# Altium schematic sheet a0206-2006.4.SchDoc
size 558 x 431 mm
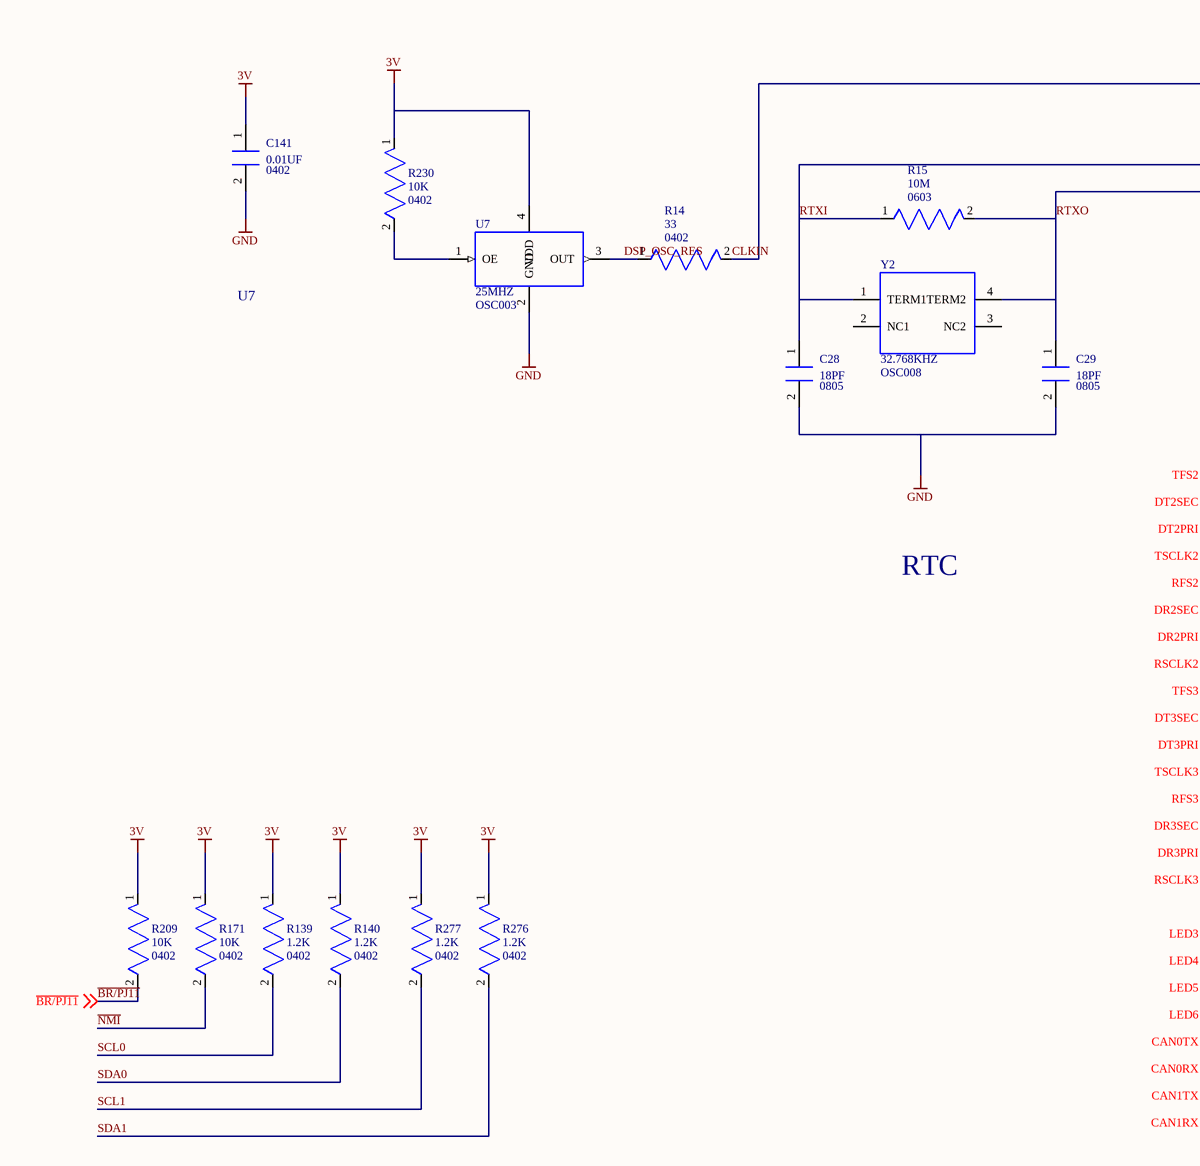
[diagram p0: a0206-2006.4.SchDoc, top left]
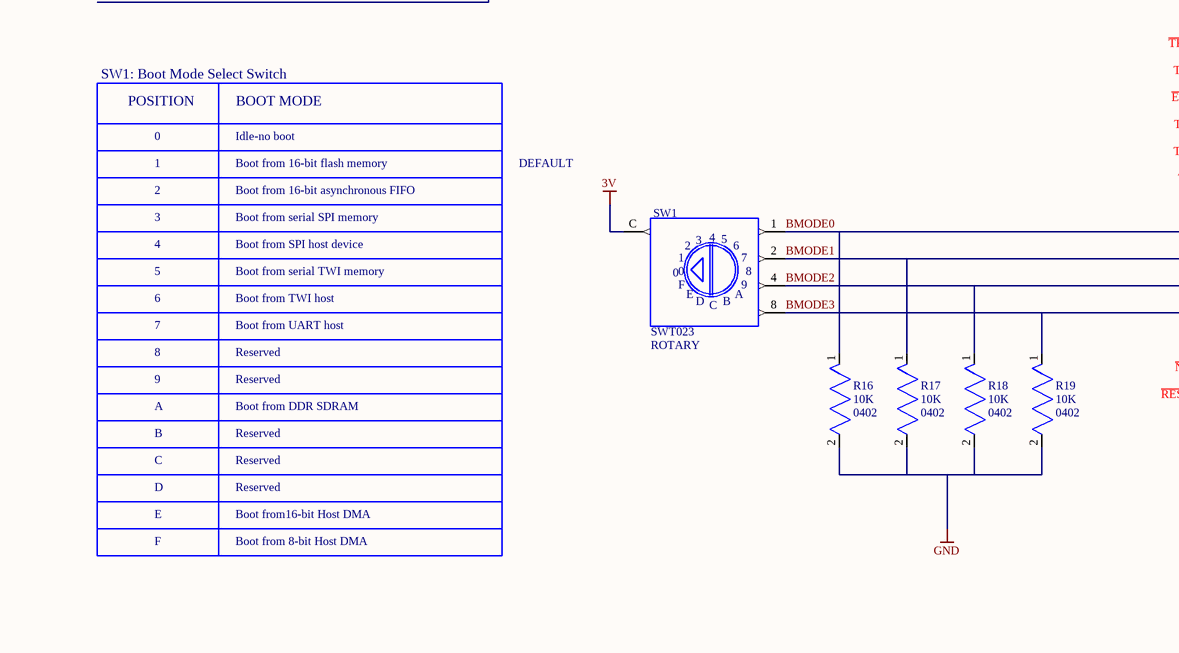
[diagram p1: a0206-2006.4.SchDoc, bottom left]
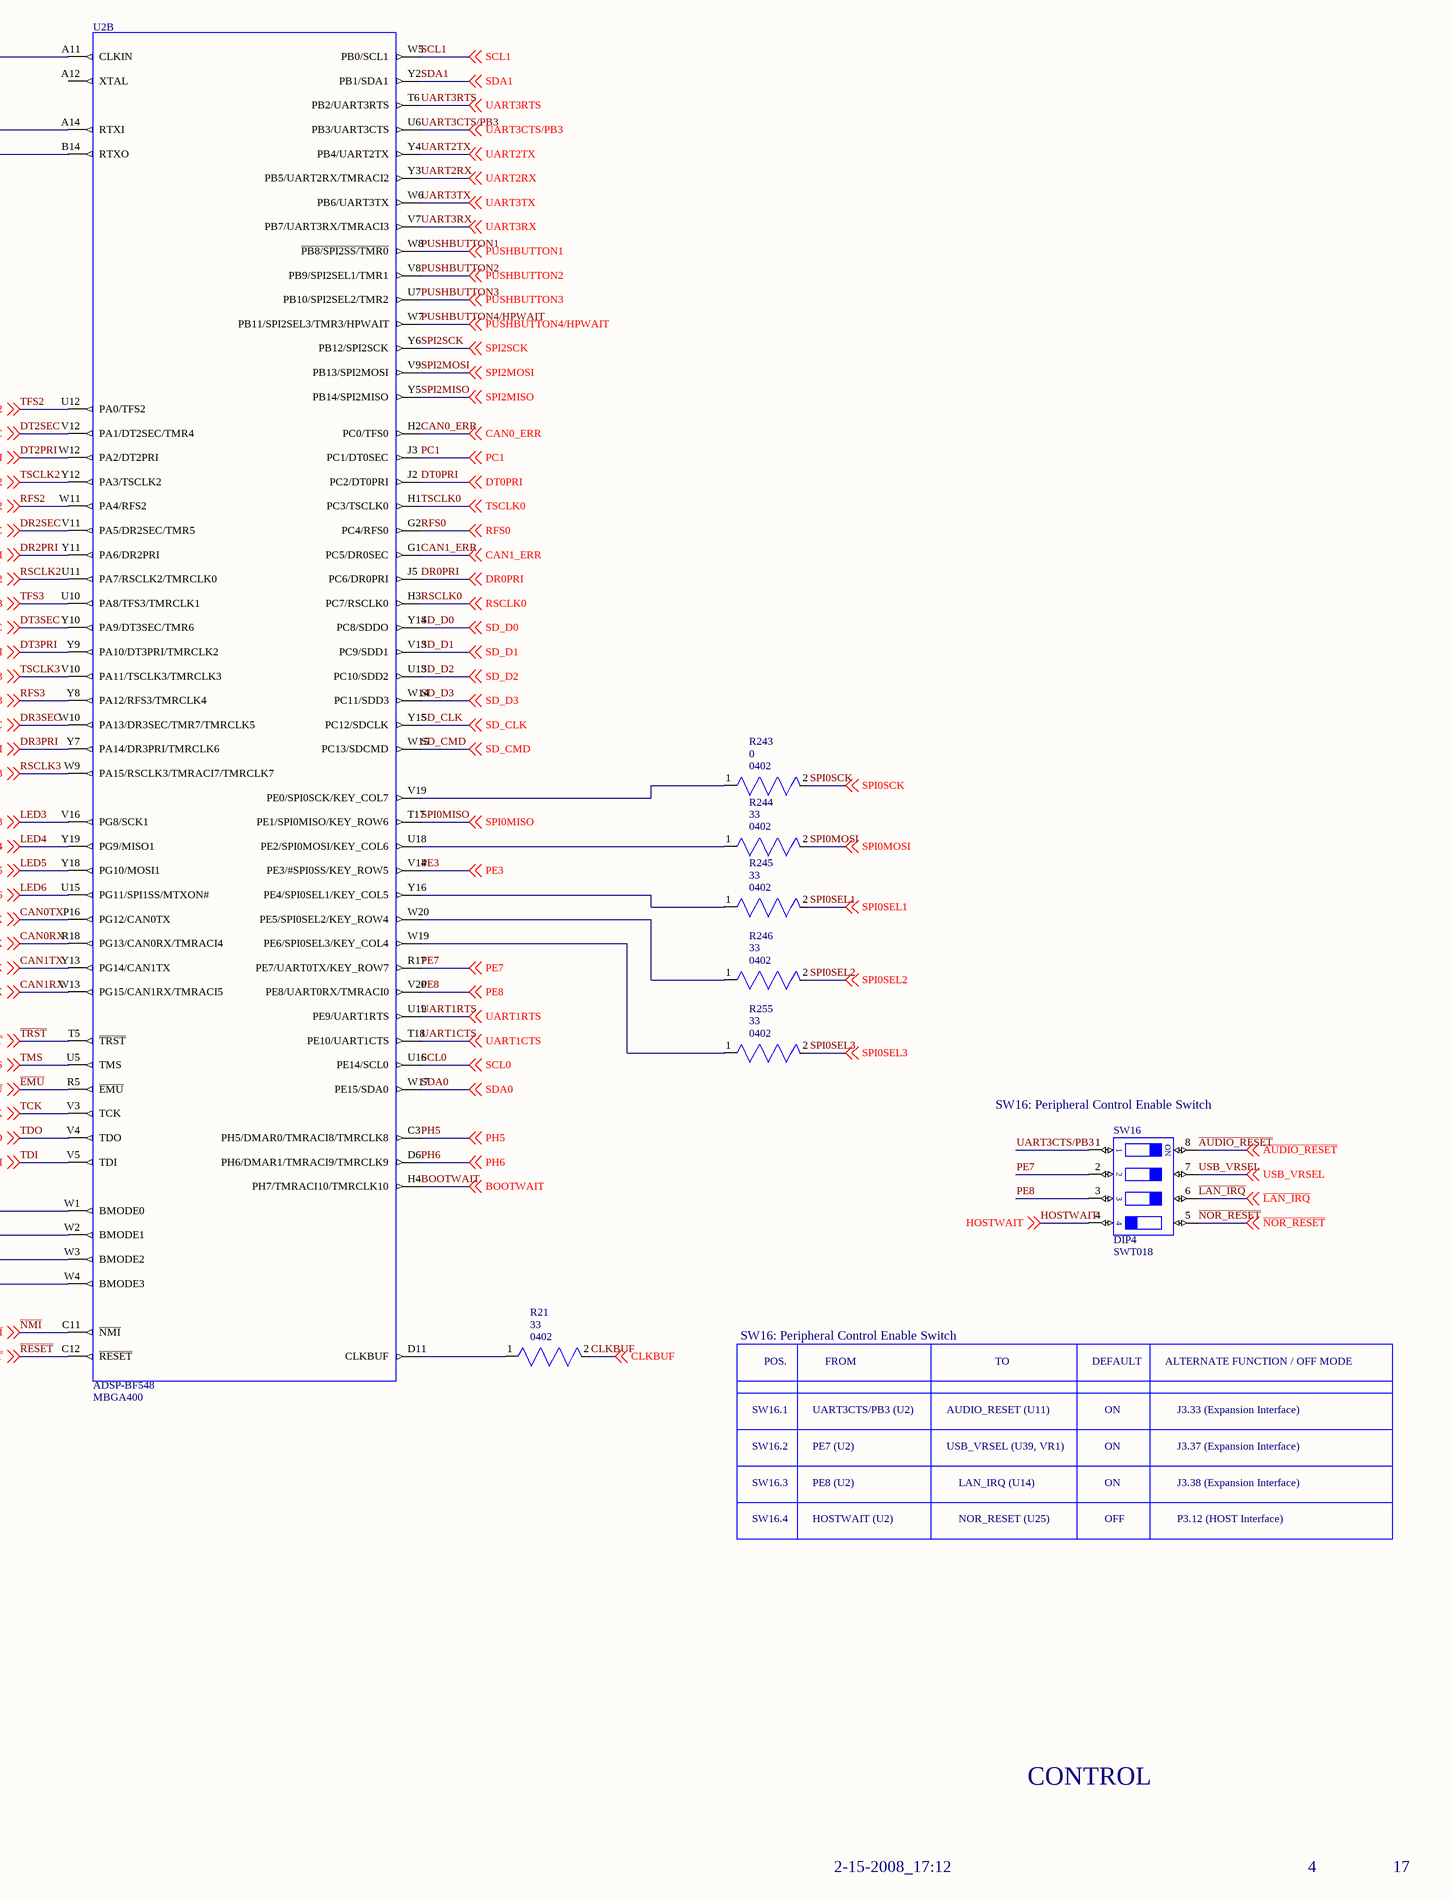
[diagram p2: a0206-2006.4.SchDoc, bottom right]

## Parts
C28  value 18PF  [0805]  (hidden comment: *)
C29  value 18PF  [0805]  (hidden comment: *)
C141  value 0.01UF  [0402]  (hidden comment: *)
R14  value 33  [0402]  (hidden comment: *)
R15  value 10M  [0603]  (hidden comment: *)
R16  value 10K  [0402]  (hidden comment: *)
R17  value 10K  [0402]  (hidden comment: *)
R18  value 10K  [0402]  (hidden comment: *)
R19  value 10K  [0402]  (hidden comment: *)
R21  value 33  [0402]  (hidden comment: *)
R139  value 1.2K  [0402]  (hidden comment: *)
R140  value 1.2K  [0402]  (hidden comment: *)
R171  value 10K  [0402]  (hidden comment: *)
R209  value 10K  [0402]  (hidden comment: *)
R230  value 10K  [0402]  (hidden comment: *)
R243  value 0  [0402]  (hidden comment: *)
R244  value 33  [0402]  (hidden comment: *)
R245  value 33  [0402]  (hidden comment: *)
R246  value 33  [0402]  (hidden comment: *)
R255  value 33  [0402]  (hidden comment: *)
R276  value 1.2K  [0402]  (hidden comment: *)
R277  value 1.2K  [0402]  (hidden comment: *)
SW1  value ROTARY  [SWT023]  (hidden comment: *)
SW16  value DIP4  [SWT018]  (hidden comment: *)
U2  PART: ADSP-BF548  PKG_TYPE: MBGA400  (hidden comment: ICS_ADSPBF548)  (part B of 7)
U7  value 25MHZ  [OSC003]  (hidden comment: *)
Y2  value 32.768KHZ  [OSC008]  (hidden comment: *)

## Nets
3V: C141.1(A) R139.1(N1) R140.1(N1) R171.1(N1) R209.1(N1) R230.1(N1) R276.1(N1) R277.1(N1) SW1.C U7.4(VDD)
GND: C28.2(B) C29.2(B) C141.2(B) R16.2(N2) R17.2(N2) R18.2(N2) R19.2(N2) U7.2(GND)
~{AUDIO_RESET}: SW16.8 ; off-sheet ~{AUDIO_RESET}
~{BR/PJ11}: R209.2(N2) ; off-sheet ~{BR/PJ11}
BMODE0: R16.1(N1) SW1.1(~{1}) U2.W1(BMODE0)
BMODE1: R17.1(N1) SW1.2(~{2}) U2.W2(BMODE1)
BMODE2: R18.1(N1) SW1.4(~{4}) U2.W3(BMODE2)
BMODE3: R19.1(N1) SW1.8(~{8}) U2.W4(BMODE3)
BOOTWAIT: U2.H4(PH7/TMRACI10/TMRCLK10) ; off-sheet BOOTWAIT
CAN0_ERR: U2.H2(PC0/TFS0) ; off-sheet CAN0_ERR
CAN0RX: U2.R18(PG13/CAN0RX/TMRACI4) ; off-sheet CAN0RX
CAN0TX: U2.P16(PG12/CAN0TX) ; off-sheet CAN0TX
CAN1_ERR: U2.G1(PC5/DR0SEC) ; off-sheet CAN1_ERR
CAN1RX: U2.W13(PG15/CAN1RX/TMRACI5) ; off-sheet CAN1RX
CAN1TX: U2.Y13(PG14/CAN1TX) ; off-sheet CAN1TX
CLKBUF: R21.2(N2) ; off-sheet CLKBUF
CLKIN: R14.2(N2) U2.A11(CLKIN)
DR0PRI: U2.J5(PC6/DR0PRI) ; off-sheet DR0PRI
DR2PRI: U2.Y11(PA6/DR2PRI) ; off-sheet DR2PRI
DR2SEC: U2.V11(PA5/DR2SEC/TMR5) ; off-sheet DR2SEC
DR3PRI: U2.Y7(PA14/DR3PRI/TMRCLK6) ; off-sheet DR3PRI
DR3SEC: U2.W10(PA13/DR3SEC/TMR7/TMRCLK5) ; off-sheet DR3SEC
DSP_OSC_RES: R14.1(N1) U7.3(OUT)
DT0PRI: U2.J2(PC2/DT0PRI) ; off-sheet DT0PRI
DT2PRI: U2.W12(PA2/DT2PRI) ; off-sheet DT2PRI
DT2SEC: U2.V12(PA1/DT2SEC/TMR4) ; off-sheet DT2SEC
DT3PRI: U2.Y9(PA10/DT3PRI/TMRCLK2) ; off-sheet DT3PRI
DT3SEC: U2.Y10(PA9/DT3SEC/TMR6) ; off-sheet DT3SEC
~{EMU}: U2.R5(~{EMU}) ; off-sheet ~{EMU}
HOSTWAIT: SW16.4 ; off-sheet HOSTWAIT
~{LAN_IRQ}: SW16.6 ; off-sheet ~{LAN_IRQ}
LED3: U2.V16(PG8/SCK1) ; off-sheet LED3
LED4: U2.Y19(PG9/MISO1) ; off-sheet LED4
LED5: U2.Y18(PG10/MOSI1) ; off-sheet LED5
LED6: U2.U15(PG11/SPI1SS/MTXON#) ; off-sheet LED6
~{NMI}: R171.2(N2) U2.C11(~{NMI}) ; off-sheet ~{NMI}
~{NOR_RESET}: SW16.5 ; off-sheet ~{NOR_RESET}
PC1: U2.J3(PC1/DT0SEC) ; off-sheet PC1
PE3: U2.V14(PE3/#SPI0SS/KEY_ROW5) ; off-sheet PE3
PE7: SW16.2 U2.R17(PE7/UART0TX/KEY_ROW7) ; off-sheet PE7
PE8: SW16.3 U2.V20(PE8/UART0RX/TMRACI0) ; off-sheet PE8
PH5: U2.C3(PH5/DMAR0/TMRACI8/TMRCLK8) ; off-sheet PH5
PH6: U2.D6(PH6/DMAR1/TMRACI9/TMRCLK9) ; off-sheet PH6
PUSHBUTTON1: U2.W8(~{PB8/SPI2SS/TMR0}) ; off-sheet PUSHBUTTON1
PUSHBUTTON2: U2.V8(PB9/SPI2SEL1/TMR1) ; off-sheet PUSHBUTTON2
PUSHBUTTON3: U2.U7(PB10/SPI2SEL2/TMR2) ; off-sheet PUSHBUTTON3
PUSHBUTTON4/HPWAIT: U2.W7(PB11/SPI2SEL3/TMR3/HPWAIT) ; off-sheet PUSHBUTTON4/HPWAIT
~{RESET}: U2.C12(~{RESET}) ; off-sheet ~{RESET}
RFS0: U2.G2(PC4/RFS0) ; off-sheet RFS0
RFS2: U2.W11(PA4/RFS2) ; off-sheet RFS2
RFS3: U2.Y8(PA12/RFS3/TMRCLK4) ; off-sheet RFS3
RSCLK0: U2.H3(PC7/RSCLK0) ; off-sheet RSCLK0
RSCLK2: U2.U11(PA7/RSCLK2/TMRCLK0) ; off-sheet RSCLK2
RSCLK3: U2.W9(PA15/RSCLK3/TMRACI7/TMRCLK7) ; off-sheet RSCLK3
RTXI: C28.1(A) R15.1(N1) U2.A14(RTXI) Y2.1(TERM1)
RTXO: C29.1(A) R15.2(N2) U2.B14(RTXO) Y2.4(TERM2)
SCL0: R139.2(N2) U2.U16(PE14/SCL0) ; off-sheet SCL0
SCL1: R277.2(N2) U2.W5(PB0/SCL1) ; off-sheet SCL1
SD_CLK: U2.Y15(PC12/SDCLK) ; off-sheet SD_CLK
SD_CMD: U2.W15(PC13/SDCMD) ; off-sheet SD_CMD
SD_D0: U2.Y14(PC8/SDDO) ; off-sheet SD_D0
SD_D1: U2.V13(PC9/SDD1) ; off-sheet SD_D1
SD_D2: U2.U13(PC10/SDD2) ; off-sheet SD_D2
SD_D3: U2.W14(PC11/SDD3) ; off-sheet SD_D3
SDA0: R140.2(N2) U2.W17(PE15/SDA0) ; off-sheet SDA0
SDA1: R276.2(N2) U2.Y2(PB1/SDA1) ; off-sheet SDA1
SPI0MISO: U2.T17(PE1/SPI0MISO/KEY_ROW6) ; off-sheet SPI0MISO
SPI0MOSI: R244.2(N2) ; off-sheet SPI0MOSI
SPI0SCK: R243.2(N2) ; off-sheet SPI0SCK
SPI0SEL1: R245.2(N2) ; off-sheet SPI0SEL1
SPI0SEL2: R246.2(N2) ; off-sheet SPI0SEL2
SPI0SEL3: R255.2(N2) ; off-sheet SPI0SEL3
SPI2MISO: U2.Y5(PB14/SPI2MISO) ; off-sheet SPI2MISO
SPI2MOSI: U2.V9(PB13/SPI2MOSI) ; off-sheet SPI2MOSI
SPI2SCK: U2.Y6(PB12/SPI2SCK) ; off-sheet SPI2SCK
~{TRST}: U2.T5(~{TRST}) ; off-sheet ~{TRST}
TCK: U2.V3(TCK) ; off-sheet TCK
TDI: U2.V5(TDI) ; off-sheet TDI
TDO: U2.V4(TDO) ; off-sheet TDO
TFS2: U2.U12(PA0/TFS2) ; off-sheet TFS2
TFS3: U2.U10(PA8/TFS3/TMRCLK1) ; off-sheet TFS3
TMS: U2.U5(TMS) ; off-sheet TMS
TSCLK0: U2.H1(PC3/TSCLK0) ; off-sheet TSCLK0
TSCLK2: U2.Y12(PA3/TSCLK2) ; off-sheet TSCLK2
TSCLK3: U2.V10(PA11/TSCLK3/TMRCLK3) ; off-sheet TSCLK3
UART1CTS: U2.T18(PE10/UART1CTS) ; off-sheet UART1CTS
UART1RTS: U2.U19(PE9/UART1RTS) ; off-sheet UART1RTS
UART2RX: U2.Y3(PB5/UART2RX/TMRACI2) ; off-sheet UART2RX
UART2TX: U2.Y4(PB4/UART2TX) ; off-sheet UART2TX
UART3CTS/PB3: SW16.1 U2.U6(PB3/UART3CTS) ; off-sheet UART3CTS/PB3
UART3RTS: U2.T6(PB2/UART3RTS) ; off-sheet UART3RTS
UART3RX: U2.V7(PB7/UART3RX/TMRACI3) ; off-sheet UART3RX
UART3TX: U2.W6(PB6/UART3TX) ; off-sheet UART3TX
USB_VRSEL: SW16.7 ; off-sheet USB_VRSEL
NetR21_1: R21.1(N1) U2.D11(CLKBUF)
NetR230_2: R230.2(N2) U7.1(OE)
NetR243_1: R243.1(N1) U2.V19(PE0/SPI0SCK/KEY_COL7)
NetR244_1: R244.1(N1) U2.U18(PE2/SPI0MOSI/KEY_COL6)
NetR245_1: R245.1(N1) U2.Y16(PE4/SPI0SEL1/KEY_COL5)
NetR246_1: R246.1(N1) U2.W20(PE5/SPI0SEL2/KEY_ROW4)
NetR255_1: R255.1(N1) U2.W19(PE6/SPI0SEL3/KEY_COL4)

Not connected (* = marked no-connect by the designer): SW1 3 5 6 7; U2 A12(XTAL); Y2 2(NC1) 3(NC2)

## Notes on the sheet
- U7
- RTC
- SW1: Boot Mode Select Switch
- POSITION
- BOOT MODE
- 1
- 0
- Idle-no boot
- Boot from 16-bit flash memory
- DEFAULT
- (near SW16) SW16: Peripheral Control Enable Switch
- 2
- 3
- 4
- Boot from 16-bit asynchronous FIFO
- Boot from serial SPI memory
- Boot from SPI host device
- 5
- 6
- Boot from serial TWI memory
- Boot from TWI host
- 7
- 8
- 9
- Reserved
- Boot from UART host
- SW16: Peripheral Control Enable Switch
- A
- B
- Boot from DDR SDRAM
- POS.
- FROM
- TO
- ALTERNATE FUNCTION / OFF MODE
- C
- D
- E
- Boot from16-bit Host DMA
- SW16.1
- SW16.2
- UART3CTS/PB3 (U2)
- PE7 (U2)
- AUDIO_RESET (U11)
- USB_VRSEL (U39, VR1)
- ON
- J3.33 (Expansion Interface)
- J3.37 (Expansion Interface)
- F
- Boot from 8-bit Host DMA
- SW16.3
- SW16.4
- PE8 (U2)
- HOSTWAIT (U2)
- LAN_IRQ (U14)
- NOR_RESET (U25)
- OFF
- J3.38 (Expansion Interface)
- P3.12 (HOST Interface)
- CONTROL
- 2-15-2008_17:12
- 17
- 20 Cotton Road
- DEVICES
- ANALOG
- Nashua, NH 03063
- PH: 1-800-ANALOGD
- Title
- ADSP-BF548 EZ-KIT LITE
- Size
- Board No.
- A0206-2006
- Rev
- 1.4B
- Date
- Sheet
- of
- (in symbol SW_DIP4.1) ON
- (in symbol SW_ROTARY_4.1) 0; F; 9; E; A; D; B

## Library data of the parts
C28 = CAP_NON_POLARIZED.2: PART_SPEC: CAPACITOR; LEVEL: STD; TYPE: NPO; BOARDS: BOTH; PRT_NUM: 7000287; TOLERANCE: 5%; VOLTAGE: 50V; PKG_TYPE: 0805; ROHS: ROHS
C29 = CAP_NON_POLARIZED.2: PART_SPEC: CAPACITOR; LEVEL: STD; TYPE: NPO; BOARDS: BOTH; PRT_NUM: 7000287; VOLTAGE: 50V; TOLERANCE: 5%; PKG_TYPE: 0805; ROHS: ROHS
C141 = CAP_NON_POLARIZED.2: PART_SPEC: CAPACITOR; LEVEL: STD; TYPE: X7R; BOARDS: BOTH; TOLERANCE: 10%; VOLTAGE: 16V; PRT_NUM: 7000279; PKG_TYPE: 0402; ROHS: ROHS
R14 R21 = RES_STANDARD.1: PART_SPEC: RESISTOR; LEVEL: STD; POWER: 1/16W; BOARDS: BOTH; TOLERANCE: 5%; PRT_NUM: 7000285; PKG_TYPE: 0402; ROHS: ROHS
R15 = RES_STANDARD.1: PART_SPEC: RESISTOR; LEVEL: STD; POWER: 1/10W; PRT_NUM: 7000366; BOARDS: BOTH; TOLERANCE: 5%; PKG_TYPE: 0603; ROHS: ROHS
R16 R18 = RES_STANDARD.2: PART_SPEC: RESISTOR; LEVEL: STD; PRT_NUM: 7000280; TOLERANCE: 5%; BOARDS: BOTH; POWER: 1/16W; PKG_TYPE: 0402; ROHS: ROHS
R17 R19 R230 = RES_STANDARD.2: PART_SPEC: RESISTOR; LEVEL: STD; POWER: 1/16W; BOARDS: BOTH; TOLERANCE: 5%; PRT_NUM: 7000280; PKG_TYPE: 0402; ROHS: ROHS
R139 R276 = RES_STANDARD.2: PART_SPEC: RESISTOR; LEVEL: STD; BOARDS: BOTH; PRT_NUM: 7000283; TOLERANCE: 5%; POWER: 1/16W; PKG_TYPE: 0402; ROHS: ROHS
R140 R277 = RES_STANDARD.2: PART_SPEC: RESISTOR; LEVEL: STD; POWER: 1/16W; TOLERANCE: 5%; PRT_NUM: 7000283; BOARDS: BOTH; PKG_TYPE: 0402; ROHS: ROHS
R171 = RES_STANDARD.2: PART_SPEC: RESISTOR; LEVEL: STD; POWER: 1/16W; TOLERANCE: 5%; PRT_NUM: 7000280; BOARDS: BOTH; PKG_TYPE: 0402; ROHS: ROHS
R209 = RES_STANDARD.2: PART_SPEC: RESISTOR; LEVEL: STD; BOARDS: BOTH; PRT_NUM: 7000280; TOLERANCE: 5%; POWER: 1/16W; PKG_TYPE: 0402; ROHS: ROHS
R243 = RES_STANDARD.1: PART_SPEC: RESISTOR; LEVEL: STD; PRT_NUM: 7000282; POWER: 1/16W; TOLERANCE: 5%; PKG_TYPE: 0402; ROHS: ROHS
R244 R246 = RES_STANDARD.1: PART_SPEC: RESISTOR; LEVEL: STD; TOLERANCE: 5%; POWER: 1/16W; PRT_NUM: 7000285; PKG_TYPE: 0402; ROHS: ROHS
R245 R255 = RES_STANDARD.1: PART_SPEC: RESISTOR; LEVEL: STD; PRT_NUM: 7000285; POWER: 1/16W; TOLERANCE: 5%; PKG_TYPE: 0402; ROHS: ROHS
SW1 = SW_ROTARY_4.1: NC: 3,5,6,7; LEVEL: STD; PRT_NUM: 6000822; PKG_TYPE: SWT023; ROHS: ROHS
SW16 = SW_DIP4.1: PART_SPEC: SWITCH; LEVEL: STD; PRT_NUM: 6000144; PKG_TYPE: SWT018; ROHS: ROHS
U2 = ICS_ADSPBF548_A: 600 MHZ; LEVEL: STD; PRT_NUM: 30-025548-02; DEVICE: ICS_ADSPBF548; ROHS: ROHS; WEB: http://www.analog.com/en/prod/0,2877,ADSP%252DBF548,00.html
U7 = OSC_SMT_OE_POWER.1: OSCILLATOR; LEVEL: STD; PRT_NUM: 1000249; PART_SPEC: OSCILLATOR; PKG_TYPE: OSC003; ROHS: ROHS
Y2 = OSC_CRYSTAL_SMT.1: CRYSTAL; LEVEL: STD; BOARDS: BOTH; PRT_NUM: 1000225; VOLTAGE: SMT; PKG_TYPE: OSC008; ROHS: ROHS